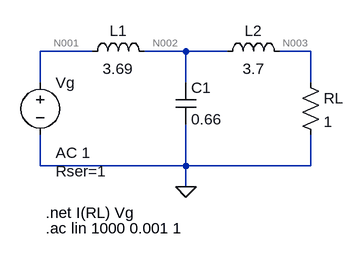
[diagram p0: schematic Circuito.asc]
Circuito.asc, the LTspice schematic file:
Version 4.1
SHEET 1 880 680
WIRE 304 64 224 64
WIRE 448 64 384 64
WIRE 512 64 448 64
WIRE 640 64 592 64
WIRE 224 112 224 64
WIRE 448 112 448 64
WIRE 640 112 640 64
WIRE 224 240 224 192
WIRE 448 240 448 176
WIRE 448 240 224 240
WIRE 640 240 640 192
WIRE 640 240 448 240
WIRE 448 272 448 240
FLAG 448 272 0
SYMBOL voltage 224 96 R0
WINDOW 123 24 124 Left 2
WINDOW 39 24 152 Left 2
SYMATTR InstName Vg
SYMATTR Value ""
SYMATTR Value2 AC 1
SYMATTR SpiceLine Rser=1
SYMBOL ind 288 80 R270
WINDOW 0 32 56 VTop 2
WINDOW 3 5 56 VBottom 2
SYMATTR InstName L1
SYMATTR Value 3.69
SYMATTR SpiceLine Rser=1m
SYMBOL cap 432 112 R0
SYMATTR InstName C1
SYMATTR Value 0.66
SYMBOL ind 496 80 R270
WINDOW 0 32 56 VTop 2
WINDOW 3 5 56 VBottom 2
SYMATTR InstName L2
SYMATTR Value 3.7
SYMATTR SpiceLine Rser=1m
SYMBOL res 624 96 R0
SYMATTR InstName RL
SYMATTR Value 1
TEXT 232 312 Left 2 !.net I(RL) Vg
TEXT 232 336 Left 2 !.ac lin 1000 0.001 1

The netlist it stands for:
* Circuito.asc
Vg N001 0 AC 1 Rser=1
L1 N001 N002 3.69 Rser=1m
C1 N002 0 0.66
L2 N002 N003 3.7 Rser=1m
RL N003 0 1
.net I(RL) Vg
.ac lin 1000 0.001 1
.backanno
.end

* Results of the author's LTspice run, read from the files saved beside the schematic
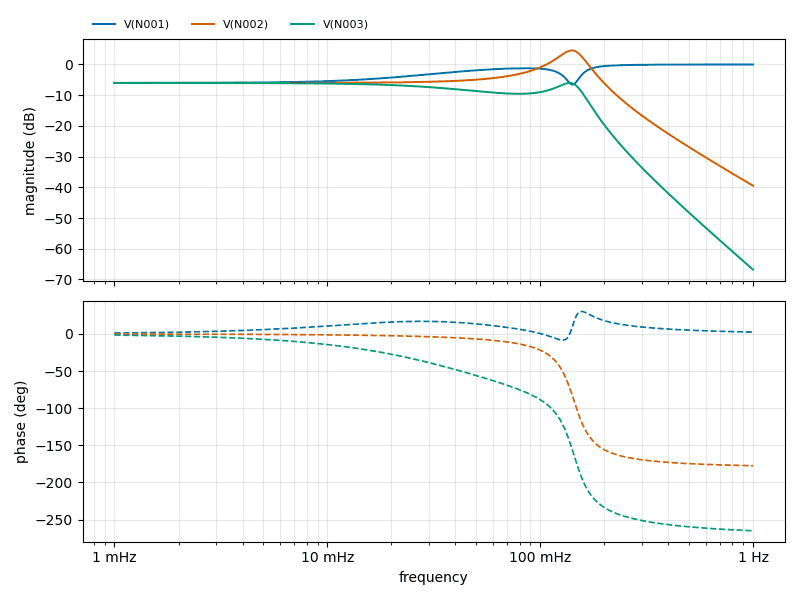
[diagram p1: AC Analysis of Circuito.asc, plotted from the saved traces]
* AC Analysis, 1 run:
*   V(N001): -6.01 dB at 1 mHz, -0.01 dB at 1 Hz, peak -0.01 dB at 1 Hz, 3 dB below the peak at 158.7 mHz
*   V(N002): -6.02 dB at 1 mHz, -39.48 dB at 1 Hz, peak 4.57 dB at 141 mHz, 3 dB below the peak at 117 mHz and 161.2 mHz
*   V(N003): -6.03 dB at 1 mHz, -66.82 dB at 1 Hz, peak -6.03 dB at 138 mHz, 3 dB below the peak at 99.57 mHz and 156.9 mHz